# EasyEDA Pro project ProPrj_STM32_无人机_2026-10-21.epro, board PCB2
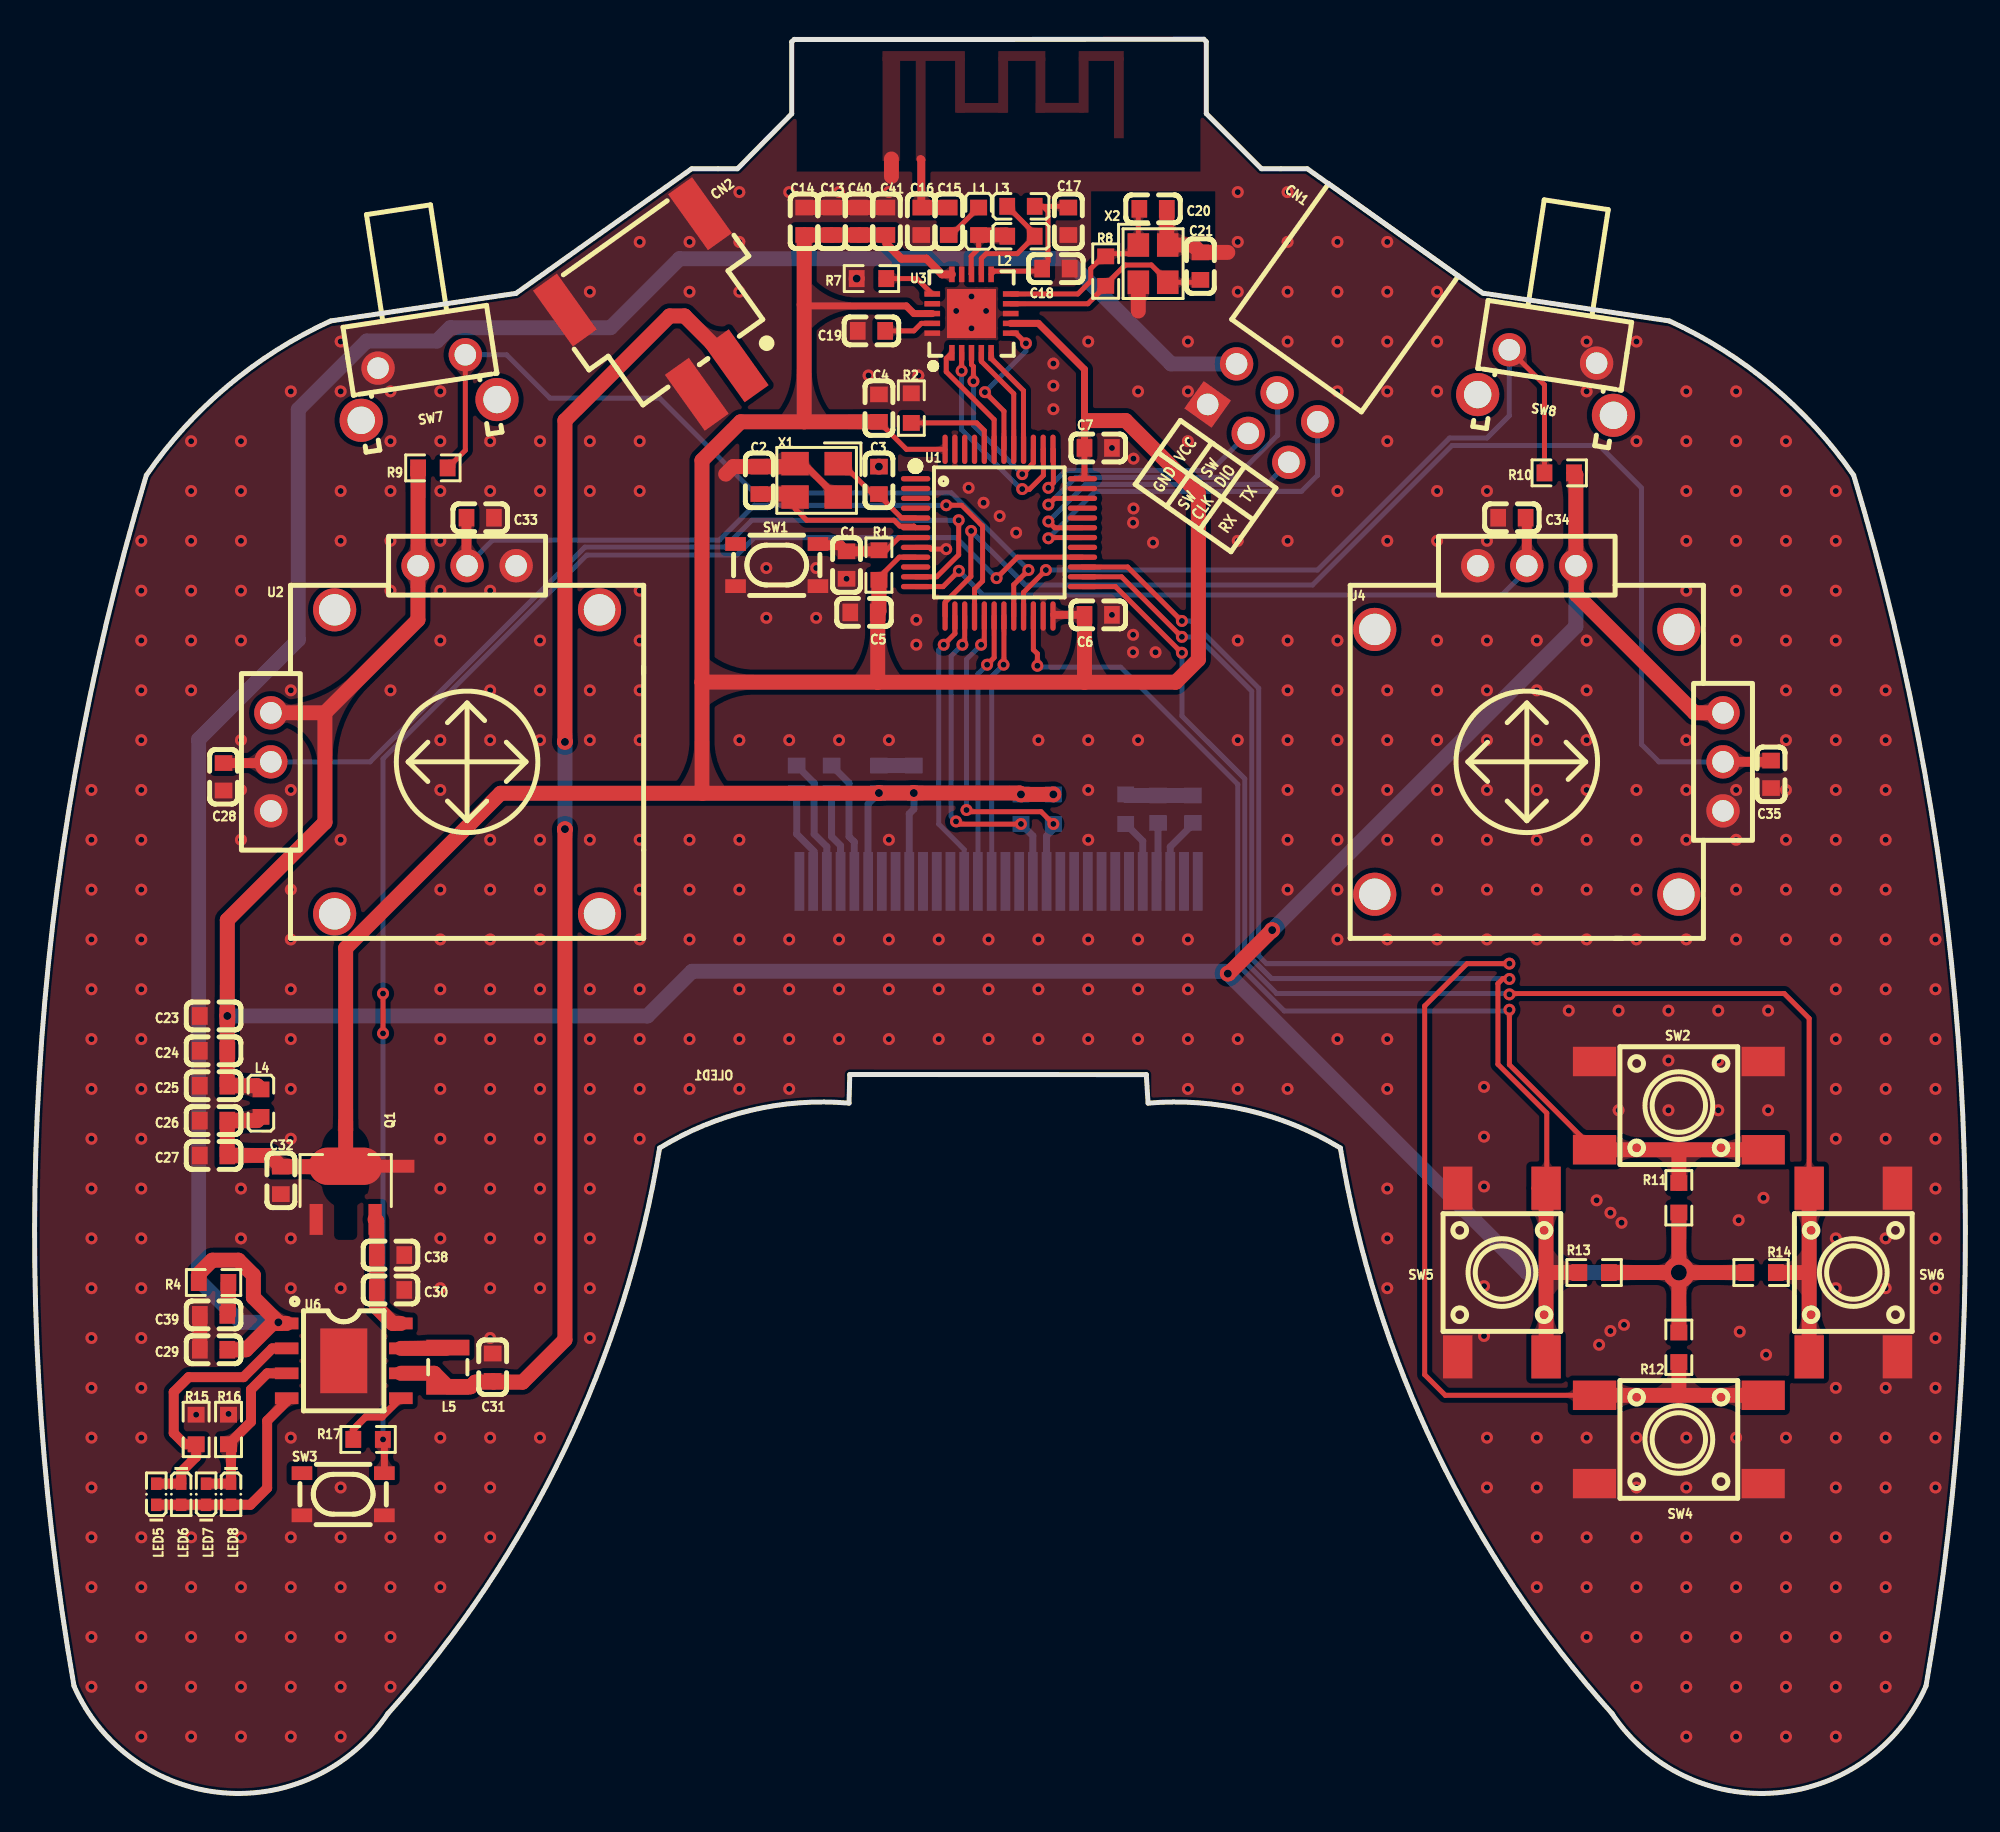
[diagram p14: board, top side]
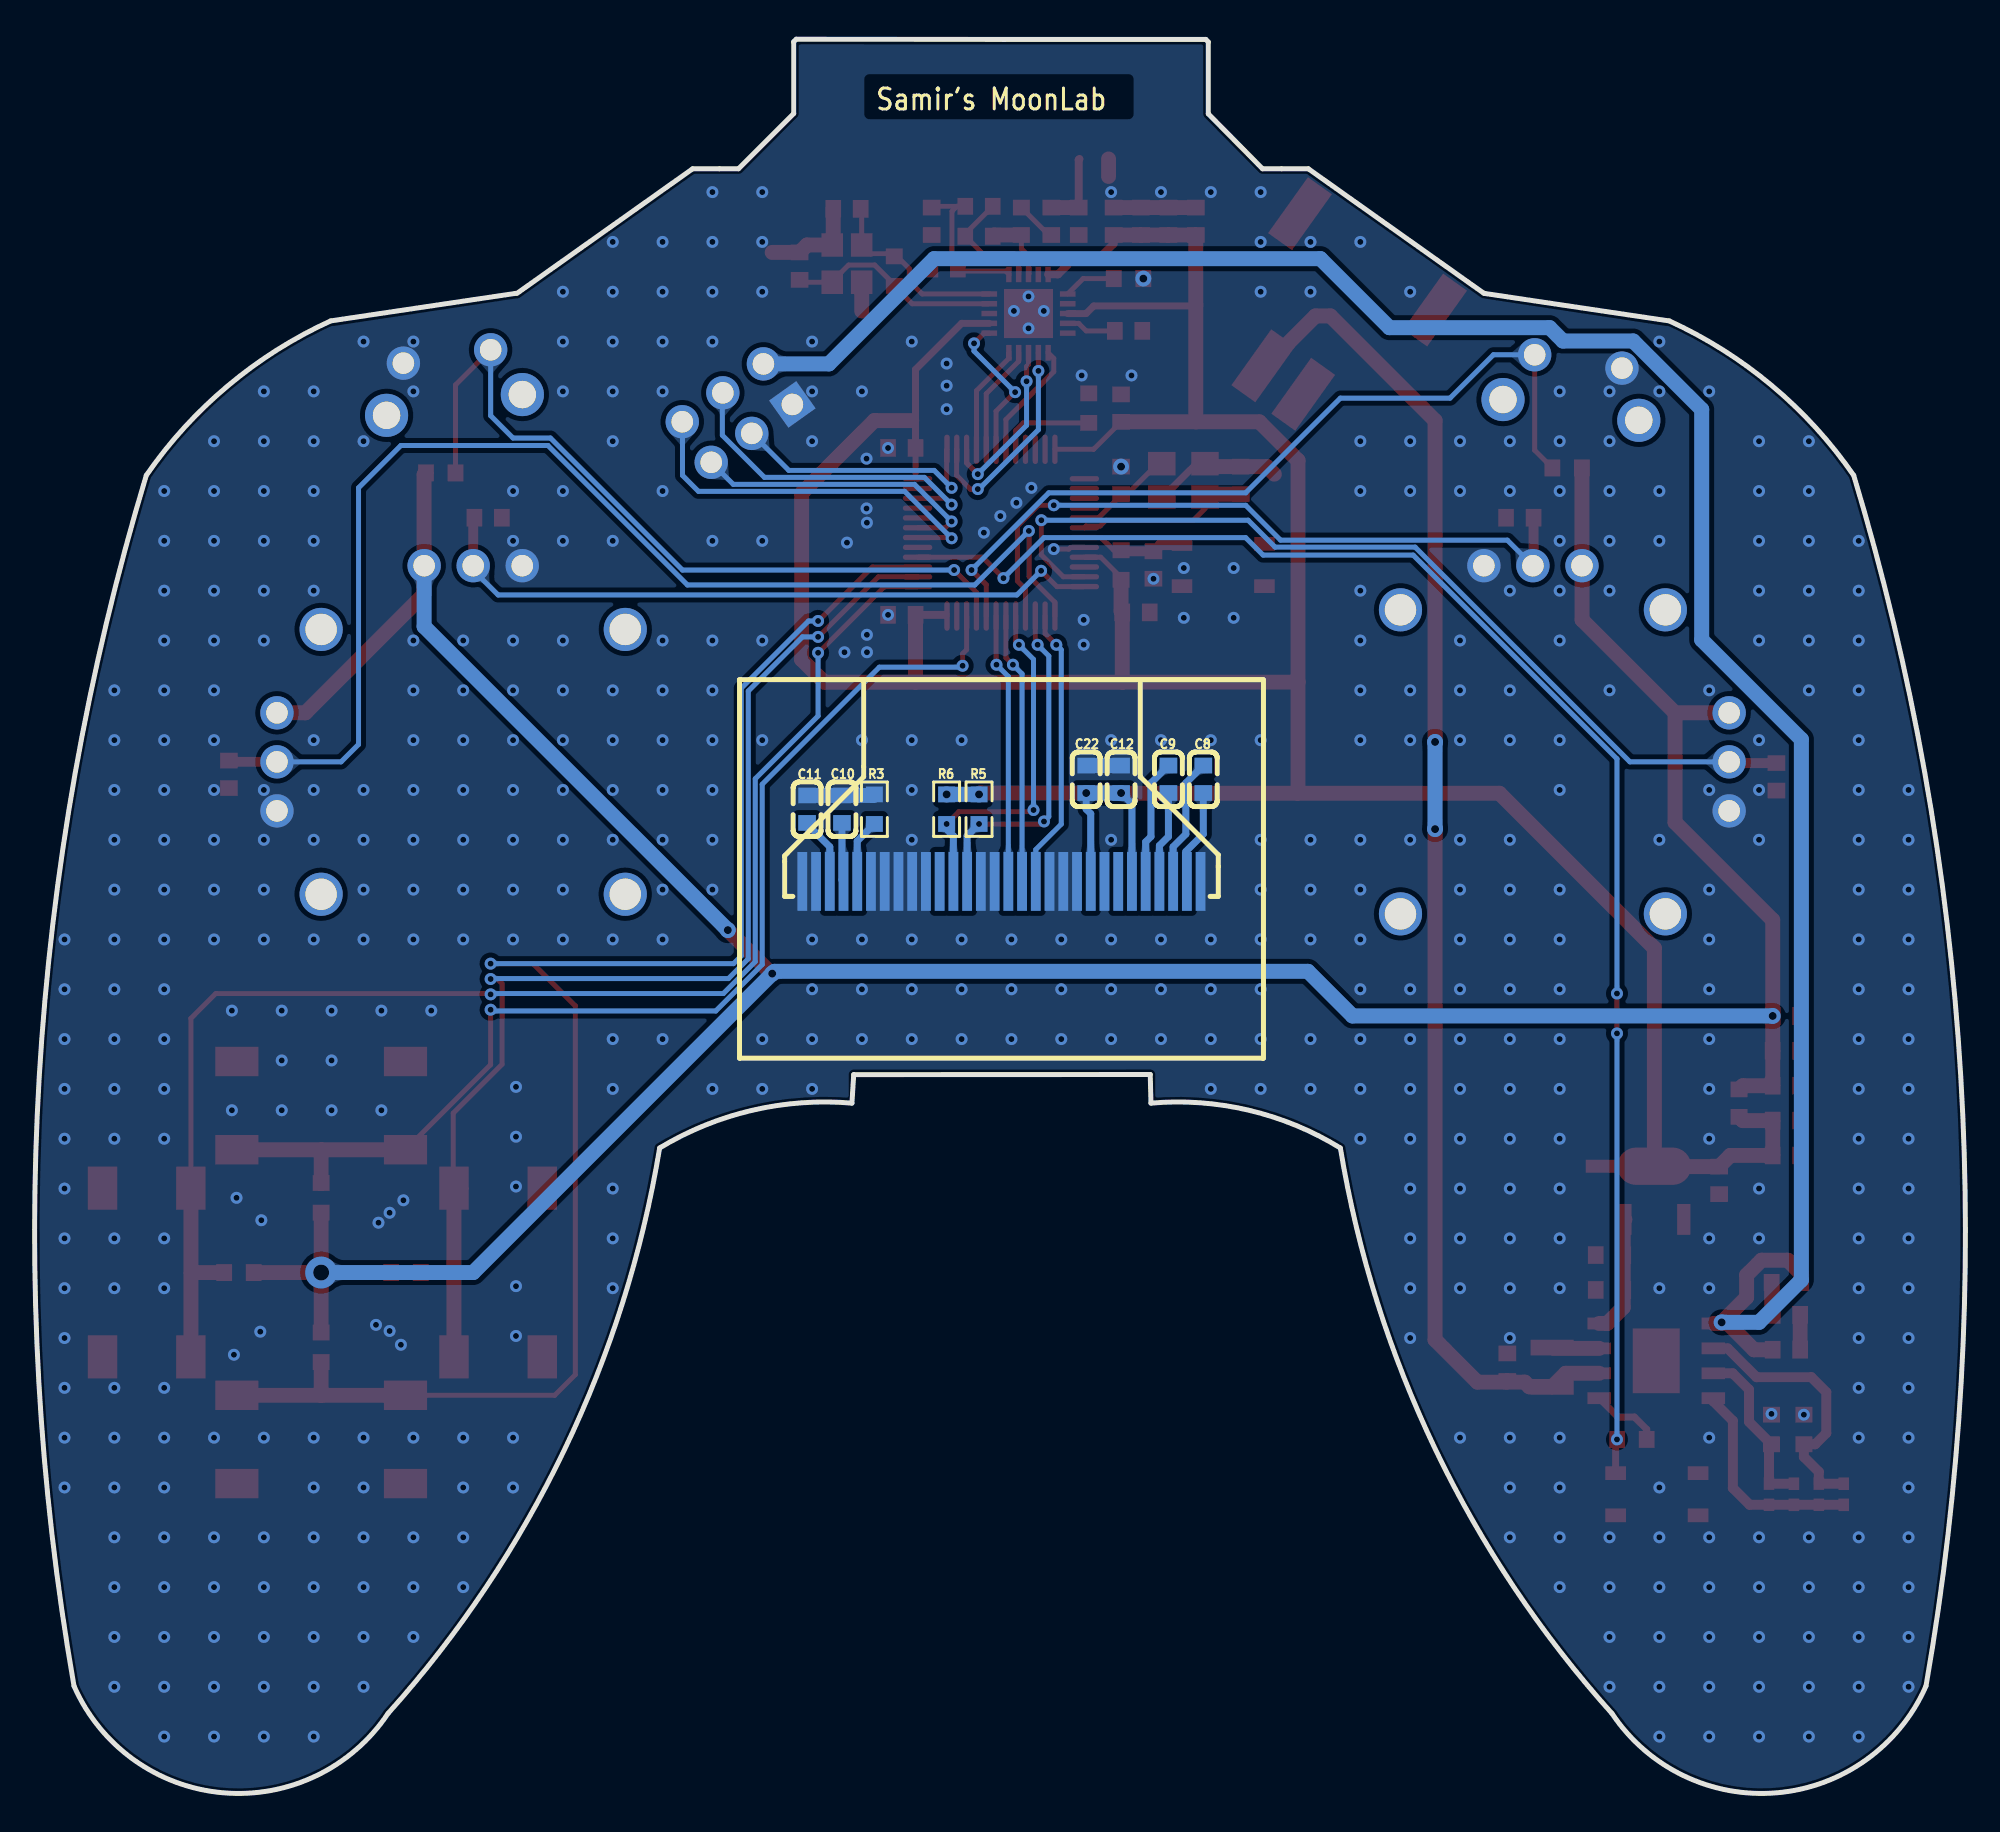
[diagram p15: board, bottom side, seen from below]

Outline 98.4 x 89.43 mm; copper layers: Top Layer, Bottom Layer. Coordinates in mm from the lower left corner of the outline.
Outline path: 73.81,76.48 64.86,82.83 62.53,82.83 59.72,85.64 59.72,89.3 59.59,89.43 49,89.42 38.71,89.42 38.59,89.29 38.59,85.63 35.82,82.83 33.49,82.83 24.54,76.48 15.09,75.07 arc(9.86,71.77) 5.69,67.2 arc(0.24,36.55) 2.01,5.47 arc(9.6,0.03) 18.01,4.08 arc(26.99,17.5) 31.86,32.91 arc(36.5,34.83) 41.51,35.19 41.55,36.65 56.66,36.65 56.75,35.19 arc(61.83,34.83) 66.55,32.91 arc(71.41,17.5) 80.39,4.08 arc(88.81,0.03) 96.39,5.47 arc(98.17,36.55) 92.71,67.2 arc(88.54,71.77) 83.31,75.07 73.87,76.48
Stack: Top Layer 0.035mm / Dielectric1 1.51mm FR4 er 4.5 / Bottom Layer 0.035mm

## Design rules (mm)
spacing copperThickness1oz (default): track to track 0.102, other pairs 0.152 to 0.3
spacing copperThickness2oz: track to track 0.203, other pairs 0.152 to 0.3
track width copperThickness1oz (default): min 0.127, default 0.254, max 2.54
track width copperThickness2oz: min 0.203, default 0.254, max 2.54
differential pair differentialPair (default): width min 0.127, default 0.254, max 2.54; gap min 0.152, default 0.152
net GND uses copperRegion

## Placement (name value [footprint] x y rotation side)
C1  100nF  [C0603]  41.38 62.62 90 top
C2  12pF  [C0603]  36.94 66.94 270 top
C3  12pF  [C0603]  43.03 66.94 90 top
C4  100nF  [C0603]  43.03 70.63 270 top
C5  100nF  [C0603]  42.27 60.21 0 top
C6  100nF  [C0603]  54.21 60.08 180 top
C7  100nF  [C0603]  54.21 68.59 180 top
C8  1uF  [C0603]  38.84 51.7 270 bottom
C9  1uF  [C0603]  40.62 51.7 270 bottom
C10  4.7uF  [C0603]  57.26 50.18 270 bottom
C11  2.2uF  [C0603]  59.03 50.18 270 bottom
C12  1uF  [C0603]  43.03 51.7 270 bottom
C13  100nF  [C0603]  40.62 80.15 270 top
C14  10uF  [C0603]  39.22 80.15 270 top
C15  1.5pF  [C0603]  46.59 80.15 90 top
C16  1pF  [C0603]  45.19 80.15 90 top
C17  4.7pF  [C0603]  52.68 80.15 90 top
C18  2.2nF  [C0603]  52.05 77.74 180 top
C19  33nF  [C0603]  42.65 74.56 180 top
C20  22pF  [C0603]  57 80.79 0 top
C21  22pF  [C0603]  59.41 77.86 270 top
C22  1uF  [C0603]  44.81 51.7 270 bottom
C23  10uF  [C0603]  9.12 39.64 0 top
C24  100nF  [C0603]  9.12 37.86 0 top
C25  1nF  [C0603]  9.12 36.08 0 top
C26  100nF  [C0603]  9.12 34.3 0 top
C27  10uF  [C0603]  9.12 32.53 0 top
C28  100nF  [C0603]  9.63 51.83 90 top
C29  10uF  [C0603]  9.12 22.62 0 top
C30  10uF  [C0603]  18.14 25.67 0 top
C31  10uF  [C0603]  23.35 21.73 90 top
C32  10uF  [C0603]  12.55 31.26 270 top
C33  100nF  [C0603]  22.71 65.04 180 top
C34  100nF  [C0603]  75.29 65.04 0 top
C35  100nF  [C0603]  88.5 51.96 90 top
C38  22uF  [C0603]  18.14 27.45 180 top
C39  10uF  [C0603]  9.12 24.4 0 top
C40  10nF  [C0603]  42.02 80.15 270 top
C41  1nF  [C0603]  43.41 80.15 270 top
CN1  IPCP254F06PB28R  [HDR-TH_6P-P2.54-H-F-R2-C3-S2.54-1]  62.59 70.37 144.5 top
CN2  ZX-XH2.54-2PWT  [CONN-SMD_2P-P2.54_MEGASTAR_ZX-XH2.54-2PWT]  32.62 75.07 215.5 top
L1  3.9nH  [L0603]  48.11 80.15 90 top
L2  8.2nH  [L0603]  50.27 79.39 180 top
L3  2.7nH  [L0603]  50.27 80.91 180 top
L4  10uH  [L0603]  11.54 35.19 270 top
L5  2.2uH  [IND-SMD_L2.5-W2.0_MHCHL2520]  21.06 21.73 270 top
LED5  XL-1005UYC  [LED0402-FD_YELLOW]  6.2 15.25 270 top
LED6  XL-1005UYC  [LED0402-FD_YELLOW]  7.47 15.25 90 top
LED7  XL-1005UYC  [LED0402-FD_YELLOW]  8.74 15.25 270 top
LED8  XL-1005UYC  [LED0402-FD_YELLOW]  10.01 15.25 90 top
NOREF  -  [Pad_e299]  45.15 83.33 90 top
NOREF#2  -  [Pad_e298]  43.67 83.33 90 top
OLED1  X096-2864TMBAG01-H30  [OLED-SMD_X096-2864TMBAG01-H30]  49.13 46.5 0 bottom
Q1  AMS1117-3.3V  [SOT-89-3_L4.5-W2.5-P1.50-LS4.2-BR]  15.85 30.62 270 top
R1  10KΩ  [R0603]  43.03 62.62 270 top
R2  10KΩ  [R0603]  44.68 70.63 90 top
R3  620KΩ  [R0603]  55.6 50.18 270 bottom
R4  2Ω  [R0603]  9.12 26.05 0 top
R5  10K  [R0603]  50.27 50.18 270 bottom
R6  10K  [R0603]  51.92 50.18 270 bottom
R7  22KΩ  [R0603]  42.65 77.23 180 top
R8  1MΩ  [R0603]  54.59 77.61 270 top
R9  10K  [R0603]  20.3 67.58 180 top
R10  10K  [R0603]  77.7 67.32 0 top
R11  10K  [R0603]  83.8 30.37 270 top
R12  10K  [R0603]  83.8 22.75 90 top
R13  10K  [R0603]  79.48 26.56 0 top
R14  10K  [R0603]  87.99 26.56 180 top
R15  100KΩ  [R0603]  8.23 18.56 270 top
R16  100KΩ  [R0603]  9.88 18.56 270 top
R17  10KΩ  [R0603]  17 18.05 0 top
SW1  SKRPACE010  [KEY-SMD_4P-L4.2-W3.2-P2.20-LS4.6]  37.82 62.62 0 top
SW2  TS-1102S-C-M-B  [KEY-SMD_4P-L6.0-W6.0-P4.50-LS8.6_TS-1102S-C-M-B]  83.8 35.07 180 top
SW3  SKRPACE010  [KEY-SMD_4P-L4.2-W3.2-P2.20-LS4.6]  15.73 15.25 0 top
SW4  TS-1102S-C-M-B  [KEY-SMD_4P-L6.0-W6.0-P4.50-LS8.6_TS-1102S-C-M-B]  83.8 18.05 180 top
SW5  TS-1102S-C-M-B  [KEY-SMD_4P-L6.0-W6.0-P4.50-LS8.6_TS-1102S-C-M-B]  74.78 26.56 270 top
SW6  TS-1102S-C-M-B  [KEY-SMD_4P-L6.0-W6.0-P4.50-LS8.6_TS-1102S-C-M-B]  92.69 26.56 270 top
SW7  UK-B02124G90-AQ25Y  [SW-TH_UK-B02124G90-AQ25Y]  19.92 71.77 188.7 top
SW8  UK-B02124G90-AQ25Y  [SW-TH_UK-B02124G90-AQ25Y]  77.19 72.02 171.3 top
U1  STM32F103C8T6  [LQFP-48_L7.0-W7.0-P0.50-LS9.0-BL]  49.15 64.28 270 top
U2  -  [油门摇杆16*16]  22.04 52.59 90 top
U3  Si24R1  [QFN-20_L4.0-W4.0-P0.50-BL-EP]  47.75 75.45 0 top
U4  -  [油门摇杆16*16]  76.05 52.59 0 top
U6  IP5305T  [ESOP-8_L4.9-W3.9-P1.27-LS6.0-BL-EP]  15.76 22.06 270 top
X1  8MHz  [CRYSTAL-SMD_4P-L3.2-W2.5-BL]  39.86 66.94 180 top
X2  16MHz  [CRYSTAL-SMD_4P-L2.5-W2.0-BL-2]  57 77.99 270 top

## Footprints (pads in the part's own frame, mm; a bottom-side part is the same pattern mirrored in y, then rotated)
C0603
  rect 0.8x0.9 smd: 1(-0.7,0) 2(0.7,0)
CONN-SMD_2P-P2.54_MEGASTAR_ZX-XH2.54-2PWT
  rect 1.5x3.5 smd: 1(-1.25,3.7) 2(1.25,3.7) 3(-4.23,-3.7) 4(4.23,-3.7)
CRYSTAL-SMD_4P-L2.5-W2.0-BL-2
  rect 1.2x1.1 smd: 1(-0.95,-0.75) 2(0.95,-0.75) 3(0.95,0.75) 4(-0.95,0.75)
CRYSTAL-SMD_4P-L3.2-W2.5-BL
  rect 1.4x1.2 smd: 1(-1.1,-0.85) 2(1.1,-0.85) 3(1.1,0.85) 4(-1.1,0.85)
ESOP-8_L4.9-W3.9-P1.27-LS6.0-BL-EP
  rect 0.6x1.2 smd: 1(-1.905,-2.909) 2(-0.635,-2.909) 3(0.635,-2.909) 4(1.905,-2.909) 5(1.905,2.909) 6(0.635,2.909) 7(-0.635,2.909) 8(-1.905,2.909)
  rect 3.3x2.4 smd: 9(0,0)
HDR-TH_6P-P2.54-H-F-R2-C3-S2.54-1
  rect 1.7x1.7 hole 1.1: 1(2.54,1.27)
  round 1.7 hole 1.1: 2(2.54,-1.27) 3(0,1.27) 4(0,-1.27) 5(-2.54,1.27) 6(-2.54,-1.27)
IND-SMD_L2.5-W2.0_MHCHL2520
  rect 0.8x2.2 smd: 1(-1,0) 2(1,0)
KEY-SMD_4P-L4.2-W3.2-P2.20-LS4.6
  rect 1.05x0.7 smd: 1(-2.1,1.075) 2(2.1,1.075) 3(-2.1,-1.075) 4(2.1,-1.075)
KEY-SMD_4P-L6.0-W6.0-P4.50-LS8.6_TS-1102S-C-M-B
  rect 2.2x1.5 smd: 1(-4.3,2.25) 2(4.3,2.25) 3(-4.3,-2.25) 4(4.3,-2.25)
L0603
  rect 0.8x0.864 smd: 1(-0.7,0) 2(0.7,0)
LED0402-FD_YELLOW
  rect 0.636x0.54 smd: 1(-0.538,0) 2(0.538,0)
LQFP-48_L7.0-W7.0-P0.50-LS9.0-BL
  oval 0.27x1.5 smd: 1(-2.75,-4.25) 2(-2.25,-4.25) 3(-1.75,-4.25) 4(-1.25,-4.25) 5(-0.75,-4.25) 6(-0.25,-4.25) 7(0.25,-4.25) 8(0.75,-4.25) 9(1.25,-4.25) 10(1.75,-4.25) 11(2.25,-4.25) 12(2.75,-4.25) 25(2.75,4.25) 26(2.25,4.25) 27(1.75,4.25) 28(1.25,4.25) 29(0.75,4.25) 30(0.25,4.25) 31(-0.25,4.25) 32(-0.75,4.25) 33(-1.25,4.25) 34(-1.75,4.25) 35(-2.25,4.25) 36(-2.75,4.25)
  oval 1.5x0.27 smd: 13(4.25,-2.75) 14(4.25,-2.25) 15(4.25,-1.75) 16(4.25,-1.25) 17(4.25,-0.75) 18(4.25,-0.25) 19(4.25,0.25) 20(4.25,0.75) 21(4.25,1.25) 22(4.25,1.75) 23(4.25,2.25) 24(4.25,2.75) 37(-4.25,2.75) 38(-4.25,2.25) 39(-4.25,1.75) 40(-4.25,1.25) 41(-4.25,0.75) 42(-4.25,0.25) 43(-4.25,-0.25) 44(-4.25,-0.75) 45(-4.25,-1.25) 46(-4.25,-1.75) 47(-4.25,-2.25) 48(-4.25,-2.75)
OLED-SMD_X096-2864TMBAG01-H30
  rect 0.5x3 smd: 1(-10.15,0) 2(-9.45,0) 3(-8.75,0) 4(-8.05,0) 5(-7.35,0) 6(-6.65,0) 7(-5.95,0) 8(-5.25,0) 9(-4.55,0) 10(-3.85,0) 11(-3.15,0) 12(-2.45,0) 13(-1.75,0) 14(-1.05,0) 15(-0.35,0) 16(0.35,0) 17(1.05,0) 18(1.75,0) 19(2.45,0) 20(3.15,0) 21(3.85,0) 22(4.55,0) 23(5.25,0) 24(5.95,0) 25(6.65,0) 26(7.35,0) 27(8.05,0) 28(8.75,0) 29(9.45,0) 30(10.15,0)
Pad_e298
  rect 0.2x0.2 smd: 2(0,0)
Pad_e299
  rect 0.2x0.2 smd: 1(0,0)
QFN-20_L4.0-W4.0-P0.50-BL-EP
  rect 0.28x0.8 smd: 1(-1,-2) 2(-0.5,-2) 3(0,-2) 4(0.5,-2) 5(1,-2) 11(1,2) 12(0.5,2) 13(0,2) 14(-0.5,2) 15(-1,2)
  rect 0.8x0.28 smd: 6(2,-1) 7(2,-0.5) 8(2,0) 9(2,0.5) 10(2,1) 16(-2,1) 17(-2,0.5) 18(-2,0) 19(-2,-0.5) 20(-2,-1)
  rect 2.5x2.5 smd: 21(0,0)
R0603
  rect 0.806x0.864 smd: 1(-0.753,0) 2(0.753,0)
SOT-89-3_L4.5-W2.5-P1.50-LS4.2-BR
  rect 1.575x0.672 smd: 1(1.356,-1.5) 3(1.356,1.5)
  custom 1.9x5.377 smd: 2(-1.356,0)
SW-TH_UK-B02124G90-AQ25Y
  round 1.7 hole 1.1: 1(-2.25,-1.25) 2(2.25,-1.25)
  round 2.2 hole 1.4: 3(-3.5,1.25) 4(3.5,1.25)
油门摇杆16*16
  round 1.7 hole 1.1: 1(-2.5,10) 2(0,10) 3(2.5,10) 4(10,2.5) 5(10,0) 6(10,-2.5)
  round 2.2 hole 1.6: 7(-7.75,6.75) 8(7.75,6.75) 9(-7.75,-6.75) 10(7.75,-6.75)

## Nets
As in the schematic, except:
GND: C1.1 C2.1 C3.2 C4.1 C5.1 C6.1 C7.1 C10.1 C11.1 C12.1 C13.1 C14.1 C16.1 C17.1 C18.1 C19.2 C20.2 C21.1 C22.1 C23.1 C24.1 C25.1 C26.1 C27.1 C28.1 C29.1 C30.2 C31.2 C32.2 C33.1 C34.1 C35.1 C38.1 C39.1 C40.1 C41.1 CN1.1 CN2.2 CN2.3 CN2.4 NOREF#2.2 OLED1.1 OLED1.8 OLED1.10 OLED1.11 OLED1.12 OLED1.16 OLED1.17 OLED1.21 OLED1.22 OLED1.23 OLED1.24 OLED1.25 OLED1.29 OLED1.30 Q1.1 R2.2 R3.1 R7.2 R15.1 R16.1 SW1.3 SW1.4 SW2.3 SW2.4 SW3.3 SW3.4 SW4.1 SW4.2 SW5.3 SW5.4 SW6.1 SW6.2 SW7.2 SW8.1 U1.8 U1.23 U1.35 U1.47 U2.1 U2.6 U3.8 U3.14 U3.17 U3.20 U3.21 U4.1 U4.6 U6.9 X1.2 X1.4 X2.2 X2.4
AT1: C15.2 C16.2 NOREF.1

Pads without a net: OLED1 7 20; SW1 1; SW3 1; SW7 3 4; SW8 3 4; U1 1 2 3 4 10 29 32 33 45 46; U2 7 8 9 10; U4 7 8 9 10

## Via types
v1: diameter 0.61, hole 0.305, Top Layer to Bottom Layer, 562 vias
v2: diameter 0.813, hole 0.406, Top Layer to Bottom Layer, 12 vias
v3: diameter 1.625, hole 0.813, Top Layer to Bottom Layer, 1 via

## Routing (per net, layer and track width the routed paths; a pad name or vN(x,y) marks a point on that pad's centre or on a via; arc(x,y) is an arc through that point)
3V3: length 192.7
  Top Layer w0.254: 43.03,61.99 44.07,63.03 U1.9 ; C4.2 44.43,68.53 U1.48
  Top Layer w0.305: C7.2 53.51,67.13 U1.36
  Top Layer w0.355: 39.22,75.89 39.28,75.83 44.43,75.83 44.82,75.44 U3.18 ; C7.2 53.51,72.59 51.16,74.94 49.75,74.94
  Top Layer w0.406: 53.26,60.08 51.96,60.08 ; C41.2 43.41,79.01 44.17,78.25 45.44,78.25 46.24,77.45 U3.15
  Top Layer w0.762: C41.2 C40.2 C13.2 C14.2 39.22,69.92 ; 34.05,50.98 23.75,50.98 15.86,43.09 Q1.2 15.83,31.95 C32.1 11.98,32.52 C27.2 C26.2 11.35,34.3 L4.2 ; 34.05,50.98 43.02,50.98 v2(43.03,51) v2(44.81,51) 50.2,51 v2(50.27,50.93) v2(51.92,50.93) ; 34.05,50.98 34.02,51.01 34.02,56.65 ; 42.97,56.65 42.97,56.65 34.02,56.65 ; 42.97,56.65 53.51,56.65 ; 42.97,56.65 C5.2 43.03,60.27 R1.2 ; 34.02,56.65 34.02,67.95 35.99,69.92 39.22,69.92 ; 39.22,69.92 43.03,69.92 ; 53.51,56.65 58.16,56.65 59.31,57.8 59.31,66.28 55.61,69.99 53.7,69.99 ; 53.51,56.65 C6.2
  Bottom Layer w0.355: OLED1.9 44.58,49.94 44.81,50.17 v2(44.81,51) ; v2(43.03,51) 42.48,50.44 OLED1.6
  Bottom Layer w0.762: v2(50.27,50.93) v2(51.92,50.93) ; v2(43.03,51) v2(44.81,51)
+5V: length 6.1
  Top Layer w0.762: Q1.3 17.44,29.17 C38.2 C30.1 17.44,24.77 18.26,23.96 U6.8
GND: length 26.9
  Top Layer w0.254: U1.8 45.6,63.53 45.69,63.44 v1(46.46,63.44)
  Top Layer w0.355: X1.4 40.89,66.09 39.19,67.79 X1.2
  Top Layer w0.762: C14.1 C13.1 C40.1 C41.1 ; X1.2 38.61,67.64 C2.1 35.61,67.64 35.22,67.26 ; C39.1 C29.1 ; C20.2 57.7,78.99 X2.4 59.04,78.94 C21.1 60.81,78.56 ; NOREF#2.2 43.67,82.43 ; X2.2 56.25,75.57
  Bottom Layer w0.762: C22.1 C12.1 ; C11.1 C10.1 55.66,50.87 R3.1
  vias: v1(2.9,51.16) v1(2.9,48.62) v1(2.9,46.08) v1(2.9,43.54) v1(2.9,41) v1(2.9,38.46) v1(2.9,35.92) v1(2.9,33.38) v1(2.9,30.84) v1(2.9,28.3) v1(2.9,25.76) v1(2.9,23.22) v1(2.9,20.68) v1(2.9,18.14) v1(2.9,15.6) v1(2.9,13.06) v1(2.9,10.52) v1(2.9,7.98) v1(2.9,5.44) v1(5.44,63.86) v1(5.44,61.32) v1(5.44,58.78) v1(5.44,56.24) v1(5.44,53.7) v1(5.44,51.16) v1(5.44,48.62) v1(5.44,46.08) v1(5.44,43.54) v1(5.44,41) v1(5.44,38.46) v1(5.44,35.92) v1(5.44,33.38) v1(5.44,30.84) v1(5.44,28.3) v1(5.44,25.76) v1(5.44,23.22) v1(5.44,20.68) v1(5.44,18.14) v1(5.44,13.06) v1(5.44,10.52) v1(5.44,7.98) v1(5.44,5.44) v1(5.44,2.9) v1(7.98,68.94) v1(7.98,66.4) v1(7.98,63.86) v1(7.98,61.32) v1(7.98,58.78) v1(7.98,56.24) v1(7.98,13.06) v1(7.98,10.52) v1(7.98,7.98) v1(7.98,5.44) v1(7.98,2.9) v1(8.23,19.31) v1(9.88,19.35) v1(10.52,68.94) v1(10.52,66.4) v1(10.52,63.86) v1(10.52,61.32) v1(10.52,58.78) v1(10.52,53.7) v1(10.52,51.16) v1(10.52,48.62) v1(10.52,30.84) v1(10.52,28.3) v1(10.52,13.06) v1(10.52,10.52) v1(10.52,7.98) v1(10.52,5.44) v1(10.52,2.9) v1(13.06,71.48) v1(13.06,56.24) v1(13.06,51.16) v1(13.06,46.08) v1(13.06,43.54) v1(13.06,41) v1(13.06,38.46) v1(13.06,35.92) v1(13.06,33.38) v1(13.06,28.3) v1(13.06,25.76) v1(13.06,18.14) v1(13.06,13.06) v1(13.06,10.52) v1(13.06,7.98) v1(13.06,5.44) v1(13.06,2.9) v1(15.6,74.02) v1(15.6,71.48) v1(15.6,66.4) v1(15.6,63.86) v1(15.6,48.62) v1(15.6,25.76) v1(15.6,15.6) v1(15.6,13.06) v1(15.6,10.52) v1(15.6,7.98) v1(15.6,5.44) v1(15.6,2.9) v1(18.14,71.48) v1(18.14,68.94) v1(18.14,66.4) v1(18.14,63.86) v1(18.14,61.32) v1(18.14,56.24) v1(18.14,13.06) v1(18.14,10.52) v1(18.14,7.98) v1(18.14,5.44) v1(20.68,71.48) v1(20.68,68.94) v1(20.68,66.4) v1(20.68,63.86) v1(20.68,61.32) v1(20.68,58.78) v1(20.68,53.7) v1(20.68,51.16) v1(20.68,46.08) v1(20.68,43.54) v1(20.68,41) v1(20.68,38.46) v1(20.68,35.92) v1(20.68,33.38) v1(20.68,30.84) v1(20.68,28.3) v1(20.68,25.76) v1(20.68,18.14) v1(20.68,15.6) v1(20.68,13.06) v1(20.68,10.52) v1(23.22,68.94) v1(23.22,66.4) v1(23.22,61.32) v1(23.22,56.24) v1(23.22,53.7) v1(23.22,48.62) v1(23.22,46.08) v1(23.22,43.54) v1(23.22,41) v1(23.22,38.46) v1(23.22,35.92) v1(23.22,33.38) v1(23.22,30.84) v1(23.22,28.3) v1(23.22,25.76) v1(23.22,23.22) v1(23.22,18.14) v1(23.22,15.6) v1(23.22,13.06) v1(25.76,68.94) v1(25.76,66.4) v1(25.76,58.78) v1(25.76,56.24) v1(25.76,53.7) v1(25.76,48.62) v1(25.76,46.08) v1(25.76,43.54) v1(25.76,41) v1(25.76,38.46) v1(25.76,35.92) v1(25.76,33.38) v1(25.76,30.84) v1(25.76,28.3) v1(25.76,25.76) v1(25.76,18.14) v1(28.3,76.56) v1(28.3,68.94) v1(28.3,66.4) v1(28.3,56.24) v1(28.3,53.7) v1(28.3,48.62) v1(28.3,41) v1(28.3,38.46) v1(28.3,35.92) v1(28.3,33.38) v1(28.3,30.84) v1(28.3,28.3) v1(28.3,25.76) v1(28.3,23.22) v1(30.84,79.1) v1(30.84,68.94) v1(30.84,66.4) v1(30.84,61.32) v1(30.84,58.78) v1(30.84,56.24) v1(30.84,53.7) v1(30.84,48.62) v1(30.84,46.08) v1(30.84,43.54) v1(30.84,41) v1(30.84,38.46) v1(30.84,35.92) v1(30.84,33.38) v1(33.38,79.1) v1(33.38,76.56) v1(33.38,48.62) v1(33.38,46.08) v1(33.38,43.54) v1(33.38,38.46) v1(33.38,35.92) v1(35.92,81.64) v1(35.92,79.1) v1(35.92,76.56) v1(35.92,53.7) v1(35.92,48.62) v1(35.92,46.08) v1(35.92,43.54) v1(35.92,41) v1(35.92,38.46) v1(35.92,35.92) v1(37.29,62.47) v1(37.29,59.93) v1(38.46,81.64) v1(38.46,53.7) v1(38.46,43.54) v1(38.46,41) v1(38.46,38.46) v1(38.46,35.92) v1(39.83,62.47) v1(39.83,59.93) v1(41,81.64) v1(41,53.7) v1(41,43.54) v1(41,41) v1(41,38.46) v1(41.38,61.92) v1(42.5,72.29) v1(43.54,81.64) v1(43.54,53.7) v1(43.54,48.62) v1(43.54,43.54) v1(43.54,41) v1(43.54,38.46) v1(44.94,59.83) v1(44.94,58.57) v1(45.04,72.29) v1(46.08,43.54) v1(46.08,41) v1(46.08,38.46) v1(46.97,75.58) v1(47.6,66.56) v1(47.75,76.32) v1(47.75,74.69) v1(48.37,65.8) v1(48.49,75.58) v1(48.62,43.54) v1(48.62,41) v1(48.62,38.46) v1(49.18,65.12) v1(50.02,64.28) v1(51.16,53.7) v1(51.16,43.54) v1(51.16,41) v1(51.16,38.46) v1(51.92,72.9) v1(51.92,71.77) v1(51.92,70.57) v1(53.7,74.02) v1(53.7,53.7) v1(53.7,51.16) v1(53.7,48.62) v1(53.7,43.54) v1(53.7,41) v1(53.7,38.46) v1(54.91,68.59) v1(54.91,60.08) v1(55.99,64.78) v1(55.99,59.07) v1(55.98,58.18) v1(56,68.05) v1(56,65.51) v1(56.24,71.48) v1(56.24,53.7) v1(56.24,43.54) v1(56.24,41) v1(56.24,38.46) v1(57,63.77) v1(57.13,58.18) v1(58.78,74.02) v1(58.78,71.48) v1(58.78,68.94) v1(58.78,43.54) v1(58.78,41) v1(58.78,38.46) v1(58.78,35.92) v1(61.32,81.64) v1(61.32,79.1) v1(61.32,76.56) v1(61.32,63.86) v1(61.32,58.78) v1(61.32,53.7) v1(61.32,38.46) v1(61.32,35.92) v1(63.86,81.64) v1(63.86,79.1) v1(63.86,76.56) v1(63.86,74.02) v1(63.86,63.86) v1(63.86,58.78) v1(63.86,56.24) v1(63.86,53.7) v1(63.86,51.16) v1(63.86,48.62) v1(63.86,46.08) v1(63.86,35.92) v1(66.4,79.1) v1(66.4,76.56) v1(66.4,74.02) v1(66.4,71.48) v1(66.4,66.4) v1(66.4,58.78) v1(66.4,56.24) v1(66.4,53.7) v1(66.4,51.16) v1(66.4,48.62) v1(66.4,46.08) v1(66.4,43.54) v1(66.4,38.46) v1(68.94,79.1) v1(68.94,76.56) v1(68.94,74.02) v1(68.94,71.48) v1(68.94,68.94) v1(68.94,63.86) v1(68.94,56.24) v1(68.94,53.7) v1(68.94,51.16) v1(68.94,48.62) v1(68.94,43.54) v1(68.94,38.46) v1(68.94,35.92) v1(68.94,30.84) v1(68.94,28.3) v1(68.94,25.76) v1(71.48,76.56) v1(71.48,74.02) v1(71.48,71.48) v1(71.48,66.4) v1(71.48,63.86) v1(71.48,58.78) v1(71.48,56.24) v1(71.48,53.7) v1(71.48,51.16) v1(71.48,48.62) v1(71.48,46.08) v1(71.48,43.54) v1(73.87,36.02) v1(73.87,33.48) v1(73.87,30.94) v1(73.87,25.86) v1(73.87,23.32) v1(74.02,66.4) v1(74.02,63.86) v1(74.02,58.78) v1(74.02,56.24) v1(74.02,53.7) v1(74.02,51.16) v1(74.02,48.62) v1(74.02,46.08) v1(74.02,43.54) v1(74.02,18.14) v1(74.02,15.6) v1(76.56,58.78) v1(76.56,56.24) v1(76.56,53.7) v1(76.56,51.16) v1(76.56,48.62) v1(76.56,46.08) v1(76.56,43.54) v1(76.56,18.14) v1(76.56,15.6) v1(76.56,13.06) v1(76.56,10.52) v1(78.19,39.91) v1(79.1,74.02) v1(79.1,71.48) v1(79.1,58.78) v1(79.1,56.24) v1(79.1,53.7) v1(79.1,51.16) v1(79.1,48.62) v1(79.1,46.08) v1(79.1,43.54) v1(79.1,18.14) v1(79.1,13.06) v1(79.1,10.52) v1(79.1,7.98) v1(79.61,30.24) v1(79.73,22.87) v1(80.31,29.6) v1(80.31,23.58) v1(80.73,39.91) v1(80.73,34.83) v1(80.88,29.1) v1(81,23.89) v1(81.64,74.02) v1(81.64,68.94) v1(81.64,51.16) v1(81.64,48.62) v1(81.64,46.08) v1(81.64,43.54) v1(81.64,18.14) v1(81.64,15.6) v1(81.64,13.06) v1(81.64,10.52) v1(81.64,7.98) v1(81.64,5.44) v1(83.27,39.91) v1(83.27,37.37) v1(83.27,34.83) v1(84.18,71.48) v1(84.18,68.94) v1(84.18,66.4) v1(84.18,63.86) v1(84.18,61.32) v1(84.18,53.7) v1(84.18,51.16) v1(84.18,48.62) v1(84.18,43.54) v1(84.18,18.14) v1(84.18,15.6) v1(84.18,13.06) v1(84.18,10.52) v1(84.18,7.98) v1(84.18,5.44) v1(84.18,2.9) v1(85.81,39.91) v1(85.81,37.37) v1(85.81,34.83) v1(86.72,71.48) v1(86.72,68.94) v1(86.72,66.4) v1(86.72,63.86) v1(86.72,61.32) v1(86.72,58.78) v1(86.72,51.16) v1(86.72,48.62) v1(86.72,46.08) v1(86.72,43.54) v1(86.72,18.14) v1(86.72,13.06) v1(86.72,10.52) v1(86.72,7.98) v1(86.72,5.44) v1(86.72,2.9) v1(86.85,29.22) v1(86.9,23.54) v1(88.11,30.37) v1(88.24,22.37) v1(88.35,39.91) v1(88.35,34.83) v1(89.26,68.94) v1(89.26,66.4) v1(89.26,63.86) v1(89.26,61.32) v1(89.26,58.78) v1(89.26,56.24) v1(89.26,53.7) v1(89.26,51.16) v1(89.26,48.62) v1(89.26,46.08) v1(89.26,43.54) v1(89.26,18.14) v1(89.26,13.06) v1(89.26,10.52) v1(89.26,7.98) v1(89.26,5.44) v1(89.26,2.9) v1(91.8,66.4) v1(91.8,63.86) v1(91.8,61.32) v1(91.8,58.78) v1(91.8,56.24) v1(91.8,53.7) v1(91.8,51.16) v1(91.8,48.62) v1(91.8,46.08) v1(91.8,43.54) v1(91.8,41) v1(91.8,38.46) v1(91.8,35.92) v1(91.8,33.38) v1(91.8,28.3) v1(91.8,25.76) v1(91.8,20.68) v1(91.8,18.14) v1(91.8,15.6) v1(91.8,13.06) v1(91.8,10.52) v1(91.8,7.98) v1(91.8,5.44) v1(91.8,2.9) v1(94.34,56.24) v1(94.34,53.7) v1(94.34,51.16) v1(94.34,48.62) v1(94.34,46.08) v1(94.34,43.54) v1(94.34,41) v1(94.34,38.46) v1(94.34,35.92) v1(94.34,33.38) v1(94.34,28.3) v1(94.34,25.76) v1(94.34,20.68) v1(94.34,18.14) v1(94.34,15.6) v1(94.34,13.06) v1(94.34,10.52) v1(94.34,7.98) v1(94.34,5.44) v1(96.88,43.54) v1(96.88,41) v1(96.88,38.46) v1(96.88,35.92) v1(96.88,33.38) v1(96.88,30.84) v1(96.88,28.3) v1(96.88,25.76) v1(96.88,23.22) v1(96.88,20.68) v1(96.88,18.14) v1(96.88,15.6) v2(41.9,77.23) v2(43.03,67.64)
S3V3: length 178.9
  Top Layer w0.762: U4.4 84.6,55.09 78.57,61.12 78.57,62.57 U4.3 78.55,67.22 R10.2 ; 14.8,55.09 14.8,49.5 9.82,44.52 v2(9.82,39.63) C24.2 C25.2 11.35,36.08 L4.1 ; 14.8,55.09 19.54,59.83 19.54,62.58 U2.4 19.55,62.59 R9.2 ; 14.8,55.09 U2.3 ; R13.2 v3(83.8,26.55) ; v3(83.8,26.55) R11.2 ; v3(83.8,26.55) R14.2 ; v3(83.8,26.55) R12.2 ; v2(63.08,44.01) 60.86,41.79 v2(60.81,41.79)
  Bottom Layer w0.762: v2(63.07,44.01) 78.55,59.49 U4.3 ; v2(9.82,39.64) 31.23,39.64 33.51,41.91 60.7,41.91 v2(60.81,41.8) 76.05,26.56 v3(83.8,26.56)
VBAT: length 68.5
  Top Layer w0.762: 35.53,72.65 35.53,72.92 33.13,75.32 32.37,75.32 27.03,69.99 v2(27.03,53.6) ; 23.35,20.96 22.46,20.96 22.22,20.73 L5.2 20.37,21.42 U6.6 ; v2(27.03,49.16) 27.03,23.12 24.87,20.96 23.41,20.96 C31.1
  Bottom Layer w0.762: v2(27.03,53.61) v2(27.03,49.16)
VCC: length 115.1
  Top Layer w0.762: 12.48,23.96 12.12,23.96 10.78,22.61 C29.2 ; 12.48,23.96 U6.1 ; 12.48,23.96 11.15,25.28 11.15,26.42 10.39,27.18 9.06,27.18 8.37,26.49 R4.1
  Bottom Layer w0.762: CN1.2 57.92,72.88 52.56,78.25 32.87,78.25 29.35,74.73 21.19,74.73 20.51,74.05 16.93,74.05 13.44,70.56 13.44,58.81 8.36,53.73 8.36,26.18 10.52,24.02 v2(12.42,24.02)
ADC1-1: length 47
  Top Layer w0.254: U1.11 45.97,62.03 47.1,63.15 v1(47.1,64.91)
  Top Layer w0.508: U2.2 11.98,52.52 C28.2
  Bottom Layer w0.254: v1(47.1,64.91) 36.55,64.91 35.18,63.54 28.05,63.54 17.1,52.59 U2.2
ADC1-2: length 35.1
  Top Layer w0.254: v1(47.11,62.33) 46.3,61.52 U1.12
  Top Layer w0.508: U4.2 76.05,64.98
  Bottom Layer w0.254: v1(47.11,62.33) 48.34,61.1 74.78,61.1 76.05,62.36 U4.2
ADC1-3: length 64.1
  Top Layer w0.254: U1.13 46.4,60.72 47.72,62.04 47.72,64.35 v1(47.73,64.36)
  Top Layer w0.508: C35.2 88.43,52.59 U4.5
  Bottom Layer w0.254: U4.5 82.78,52.59 81.9,53.48 81.9,66.56 79.74,68.72 72.24,68.72 65.13,61.6 50.49,61.6 v1(47.73,64.36)
ADC1-6: length 35.2
  Top Layer w0.254: v1(46.46,65.67) 47.25,65.67 48.32,64.6 48.32,61.81 47.9,61.39 U1.16
  Top Layer w0.508: U2.5 22.01,62.62 C33.2
  Bottom Layer w0.254: U2.5 23.34,63.89 34.9,63.89 36.68,65.67 v1(46.46,65.67)
AT1: length 3.9
  Top Layer w0.406: NOREF.1 45.19,83.28 C16.2
  Top Layer w0.762: C16.2 C15.2
KEY-DOWN: length 81.5
  Top Layer w0.254: v1(58.48,59.77) 58.46,59.77 55.71,62.52 U1.27 ; SW4.4 71.9,20.29 70.85,21.34 70.85,40.14 73.01,42.3 v1(75.16,42.3)
  Top Layer w0.762: R12.1 83.8,20.29 ; SW4.4 SW4.3
  Bottom Layer w0.254: v1(75.16,42.3) 62.79,42.3 62.39,42.7 62.39,56.34 58.96,59.77 v1(58.48,59.77)
KEY-LEFT: length 61.3
  Top Layer w0.254: U1.26 55.4,62.02 58.46,58.96 v1(58.48,58.96) ; 75.11,41.54 74.83,41.54 74.58,41.28 74.58,37.17 77.07,34.68 77.07,30.85 SW5.1 76.4,30.85
  Top Layer w0.762: SW5.1 SW5.2 ; R13.1 77.03,26.55
  Bottom Layer w0.254: v1(75.16,41.52) 75.14,41.54 63.04,41.54 62.03,42.55 62.03,56.2 59.27,58.96 v1(58.47,58.96)
KEY-LEFT-X: length 42
  Top Layer w0.254: SW7.1 21.95,68.47 R9.1 ; U1.20 49.9,61.62 v1(50.65,62.37)
  Bottom Layer w0.254: v1(50.65,62.37) 46.72,66.3 36.68,66.3 31.86,71.13 26.27,71.13 24.06,73.34 SW7.1
KEY-RIGHT: length 72.4
  Top Layer w0.254: v1(58.47,58.15) 58.46,58.15 55.08,61.53 U1.25 ; SW6.3 90.44,39.51 89.17,40.78 75.16,40.78
  Top Layer w0.762: SW6.3 SW6.4 ; R14.1 90.42,26.55
  Bottom Layer w0.254: v1(58.48,58.15) 58.48,54.93 61.68,51.72 61.68,42.4 63.3,40.78 75.12,40.78 v1(75.16,40.73)
KEY-RIGHT-X: length 40.1
  Top Layer w0.254: R10.1 76.95,71.8 SW8.2 ; U1.21 50.4,61.23 v1(51.54,62.37)
  Bottom Layer w0.254: v1(51.54,62.37) 65.39,62.37 72.12,69.1 74.02,69.1 75.16,70.24 SW8.2
KEY-UP: length 58.6
  Top Layer w0.254: v1(75.16,39.95) 75.16,37.15 SW2.2 ; U1.22 50.9,58.31 51.11,58.11 v1(51.11,57.49)
  Top Layer w0.762: R11.1 83.8,32.79 83.78,32.81 ; SW2.2 83.78,32.81 ; 83.78,32.81 SW2.1
  Bottom Layer w0.254: v1(51.11,57.49) 51.18,57.42 55.35,57.42 61.32,51.45 61.32,42.26 63.69,39.89 75.1,39.89 v1(75.16,39.95)
NRST: length 5.4
  Top Layer w0.254: U1.7 44.05,64.03 43.4,63.38 R1.1
  Top Layer w0.508: R1.1 42.98,63.32 C1.2 41.07,63.64 39.99,63.64 SW1.2
OLED-CLK: length 17.4
  Top Layer w0.254: v1(47.29,58.56) 47.4,58.67 U1.15 ; v1(50.27,49.42) 50.26,49.41 47.1,49.41 v1(46.96,49.55)
  Bottom Layer w0.254: v1(47.29,58.56) 46.71,57.99 46.71,49.8 v1(46.96,49.55)
  Bottom Layer w0.355: OLED1.18 50.88,48.81 v1(50.27,49.42)
OLED-CS: length 14.4
  Top Layer w0.254: v1(46.33,58.56) 46.9,59.13 U1.14
  Bottom Layer w0.254: v1(46.33,58.56) 46.08,58.31 46.08,49.42 47.38,48.12 OLED1.13
OLED-D/C: length 13.8
  Top Layer w0.254: v1(49.38,57.54) 49.4,57.56 U1.19
  Bottom Layer w0.254: v1(49.38,57.54) 48.78,56.94 OLED1.15
OLED-DIN: length 18.1
  Top Layer w0.254: v1(48.24,58.56) 48.4,58.72 U1.17 ; v1(51.92,49.42) 51.3,50.05 47.58,50.05 v1(47.5,50.13)
  Bottom Layer w0.254: v1(47.49,50.14) 47.49,57.82 v1(48.24,58.56)
  Bottom Layer w0.355: OLED1.19 51.58,48.81 51.92,49.16 v1(51.92,49.42)
OLED-RES: length 13.9
  Top Layer w0.254: U1.18 48.9,57.9 v1(48.55,57.54)
  Bottom Layer w0.254: v1(48.54,57.54) 48.08,57.08 OLED1.14
OSC_IN: length 5.1
  Top Layer w0.254: X1.1 41.17,67.79 42.72,66.24 C3.1 43.03,66.18 44.19,65.02 U1.5
OSC_OUT: length 9
  Top Layer w0.254: U1.6 44.82,64.61 44.1,64.61 43.8,64.91 39.35,64.91 38.76,65.5 X1.3
  Top Layer w0.762: X1.3 38.61,66.24 C2.2
PA9: length 19.5
  Top Layer w0.254: U1.30 51.7,64.03 v1(51.67,63.99)
  Bottom Layer w0.254: CN1.6 65.39,69.91 65.39,67.19 64.57,66.38 54.06,66.38 v1(51.67,63.98)
PA10: length 15.4
  Top Layer w0.254: v1(51.67,64.84) 51.99,64.52 U1.31
  Bottom Layer w0.254: v1(51.67,64.84) 53.56,66.73 62.8,66.73 CN1.5
PA13: length 17.2
  Top Layer w0.254: U1.34 51.99,66.02 v1(51.67,65.7)
  Bottom Layer w0.254: v1(51.67,65.7) 53.06,67.09 61.21,67.09 63.35,69.24 63.35,71.38 CN1.4
PA14: length 13.4
  Top Layer w0.254: v1(51.67,66.56) 51.92,66.81 51.92,68.5 U1.37
  Bottom Layer w0.254: v1(51.67,66.56) 52.56,67.45 59.96,67.45 61.85,69.34
PA15: length 11
  Top Layer w0.254: U3.2 47.25,73.44 v1(47.25,72.52) ; 50.27,66.49 50.28,66.48 50.7,66.48 51.42,67.19 51.42,68.51 U1.38
  Bottom Layer w0.254: 50.27,66.5 47.24,69.52 v1(47.24,72.52)
  vias: v1(50.33,66.5)
PB3: length 8.8
  Top Layer w0.254: v1(47.85,71.99) 47.85,72.74 47.75,72.84 U3.3 ; v1(50.34,67.26) 50.57,67.49 50.58,67.49 50.82,67.73 50.82,67.74 50.9,67.82 U1.39
  Bottom Layer w0.254: v1(47.85,71.99) 47.85,69.75 v1(50.33,67.26)
PB4: length 5.6
  Top Layer w0.254: U3.5 48.75,73.16 50.4,71.51 50.4,68.53 U1.40
PB5: length 5.6
  Top Layer w0.254: U3.4 48.25,73.01 49.9,71.36 U1.41
PB6: length 7.7
  Top Layer w0.254: v1(48.43,71.43) 49.4,70.46 U1.42 ; U3.6 50.01,74.44 v1(50.53,73.92)
  Bottom Layer w0.254: v1(50.52,73.93) 50.52,73.53 v1(48.43,71.44)
PB7: length 6.1
  Top Layer w0.254: U3.1 46.46,73.15 46.46,72.48 48.9,70.03 U1.43
PB15: length 78.1
  Top Layer w0.254: v1(49.03,61.95) 50.1,63.02 U1.28 ; v1(17.76,18.04) R17.2 ; v1(17.76,40.78) v1(17.76,38.74)
  Top Layer w0.355: SW3.2 17.83,17.97 R17.2
  Bottom Layer w0.254: v1(17.76,40.78) 17.76,52.75 28.14,63.13 35.79,63.13 36.68,64.02 46.96,64.02 v1(49.03,61.96) ; v1(17.76,38.75) v1(17.76,18.05)
XI: length 9.5
  Top Layer w0.254: 54.83,78.5 55.81,78.5 X2.1 56.25,80.74 C20.1 ; U3.10 53.17,76.45 53.83,77.1 53.83,77.74 54.45,78.36 R8.1
XO: length 10.7
  Top Layer w0.254: C21.2 59.29,77.04 X2.3 57.75,77.08 56.92,77.92 55.59,77.92 54.75,77.08 ; U3.9 53.68,75.94 R8.2
$1N88: length 4.8
  Top Layer w0.254: R2.1 48.02,69.87 48.4,69.48 U1.44
$2N38: length 2.9
  Top Layer w0.254: U3.16 44.96,77.23 43.15,77.23
$2N40: length 2.6
  Top Layer w0.254: C19.1 44.81,74.56 45.2,74.94 45.75,74.94
$2N42: length 7.8
  Top Layer w0.254: C17.2 52.62,80.91 51.4,80.91 ; 51.4,80.91 51.65,80.65 51.65,78.1 51.16,77.61 48.92,77.61 U3.11 ; 51.4,80.91 L3.1
$2N43: length 6.1
  Top Layer w0.254: U3.12 48.25,78.26 48.49,78.5 50.08,78.5 L2.1 50.97,79.51 L3.2
$2N44: length 2.1
  Top Layer w0.254: C15.1 46.71,79.45 L1.2
$2N45: length 3.7
  Top Layer w0.254: L1.1 48.11,78.75 47.73,78.37 47.73,77.46 U3.13
  Top Layer w0.762: L2.2 49.51,79.45 L1.1
$3N26: length 1.7
  Top Layer w0.762: R4.2 9.88,24.45 C39.2
$3N28: length 3.6
  Top Layer w0.355: U6.5 17.71,19.19 16.87,19.19 16.24,18.56 R17.1
$3N30: length 2.3
  Top Layer w0.762: U6.7 20.97,22.69
$3N37: length 8.8
  Top Layer w0.508: U6.3 11.86,21.42 11.03,20.58 11.03,18.94 R16.2 10.01,17.67 LED8.2 LED7.1
$3N38: length 13.7
  Top Layer w0.508: U6.2 12.11,22.69 10.65,21.22 7.85,21.22 7.09,20.46 7.09,18.37 7.66,17.8 R15.2 8.23,17.16 7.47,16.4 LED6.2 LED5.1
$3N39: length 11
  Top Layer w0.508: U6.4 12.85,19.99 11.86,19 11.86,15.57 11,14.71 LED8.1 ; 10.01,14.71 LED7.2 LED5.2
$4N2: length 4.9
  Bottom Layer w0.355: C8.2 38.84,48.9 39.73,48.01 39.73,46.54 OLED1.2
$4N3: length 6.5
  Bottom Layer w0.355: OLED1.3 40.38,48.26 39.73,48.9 39.73,51.51 C8.1
$4N4: length 4.7
  Bottom Layer w0.355: C9.2 40.62,48.78 41.08,48.32 OLED1.4
$4N5: length 6.4
  Bottom Layer w0.355: C9.1 41.51,51.51 41.51,48.78 41.78,48.51 OLED1.5
$4N16: length 3.3
  Bottom Layer w0.355: R3.2 56.48,48.55 OLED1.26
$4N18: length 3
  Bottom Layer w0.355: C10.2 57.26,46.57 OLED1.27
$4N19: length 3.5
  Bottom Layer w0.355: OLED1.28 57.88,48.26 59.04,49.41 C11.2

## Copper pours and planes (outline as drawn; the poured copper is in the pictures)
GND on Top Layer: -22.12,93.23 124.31,93.23 124.31,-3.03 -22.12,-3.03
GND on Bottom Layer: -1.29,111.65 100.56,111.65 100.56,-13.19 -1.29,-13.19
AT1 on Top Layer: 49.11,88.83 51.51,88.83 51.51,88.33 49.11,88.33
AT1 on Top Layer: 53.21,88.83 55.51,88.83 55.51,88.33 53.21,88.33
AT1 on Top Layer: 46.91,88.51 47.41,88.51 47.41,85.69 46.91,85.69
AT1 on Top Layer: 49.11,88.51 49.61,88.51 49.61,85.69 49.11,85.69
AT1 on Top Layer: 51.01,88.51 51.51,88.51 51.51,85.69 51.01,85.69
AT1 on Top Layer: 53.21,88.51 53.71,88.51 53.71,85.69 53.21,85.69
AT1 on Top Layer: 51.03,86.19 53.52,86.19 53.52,85.69 51.03,85.69
AT1 on Top Layer: 43.21,88.53 44.11,88.53 44.11,83.23 43.21,83.23
AT1 on Top Layer: 55.01,88.51 55.51,88.51 55.51,84.39 55.01,84.39
AT1 on Top Layer: 44.91,88.56 45.41,88.56 45.41,83.23 44.91,83.23
AT1 on Top Layer: 47,86.18 49.54,86.18 49.54,85.69 47,85.69
AT1 on Top Layer: 43.21,88.83 47.41,88.83 47.41,88.33 43.21,88.33

Small or netless copper shapes (teardrops, artwork), in the pictures only: 284 on Top Layer, 98 on Bottom Layer

## Text on the board
Bottom Silkscreen Layer: Samir's MoonLab
Top Silkscreen Layer: GND | VCC | SW / CLK | SW / DIO | RX | TX
